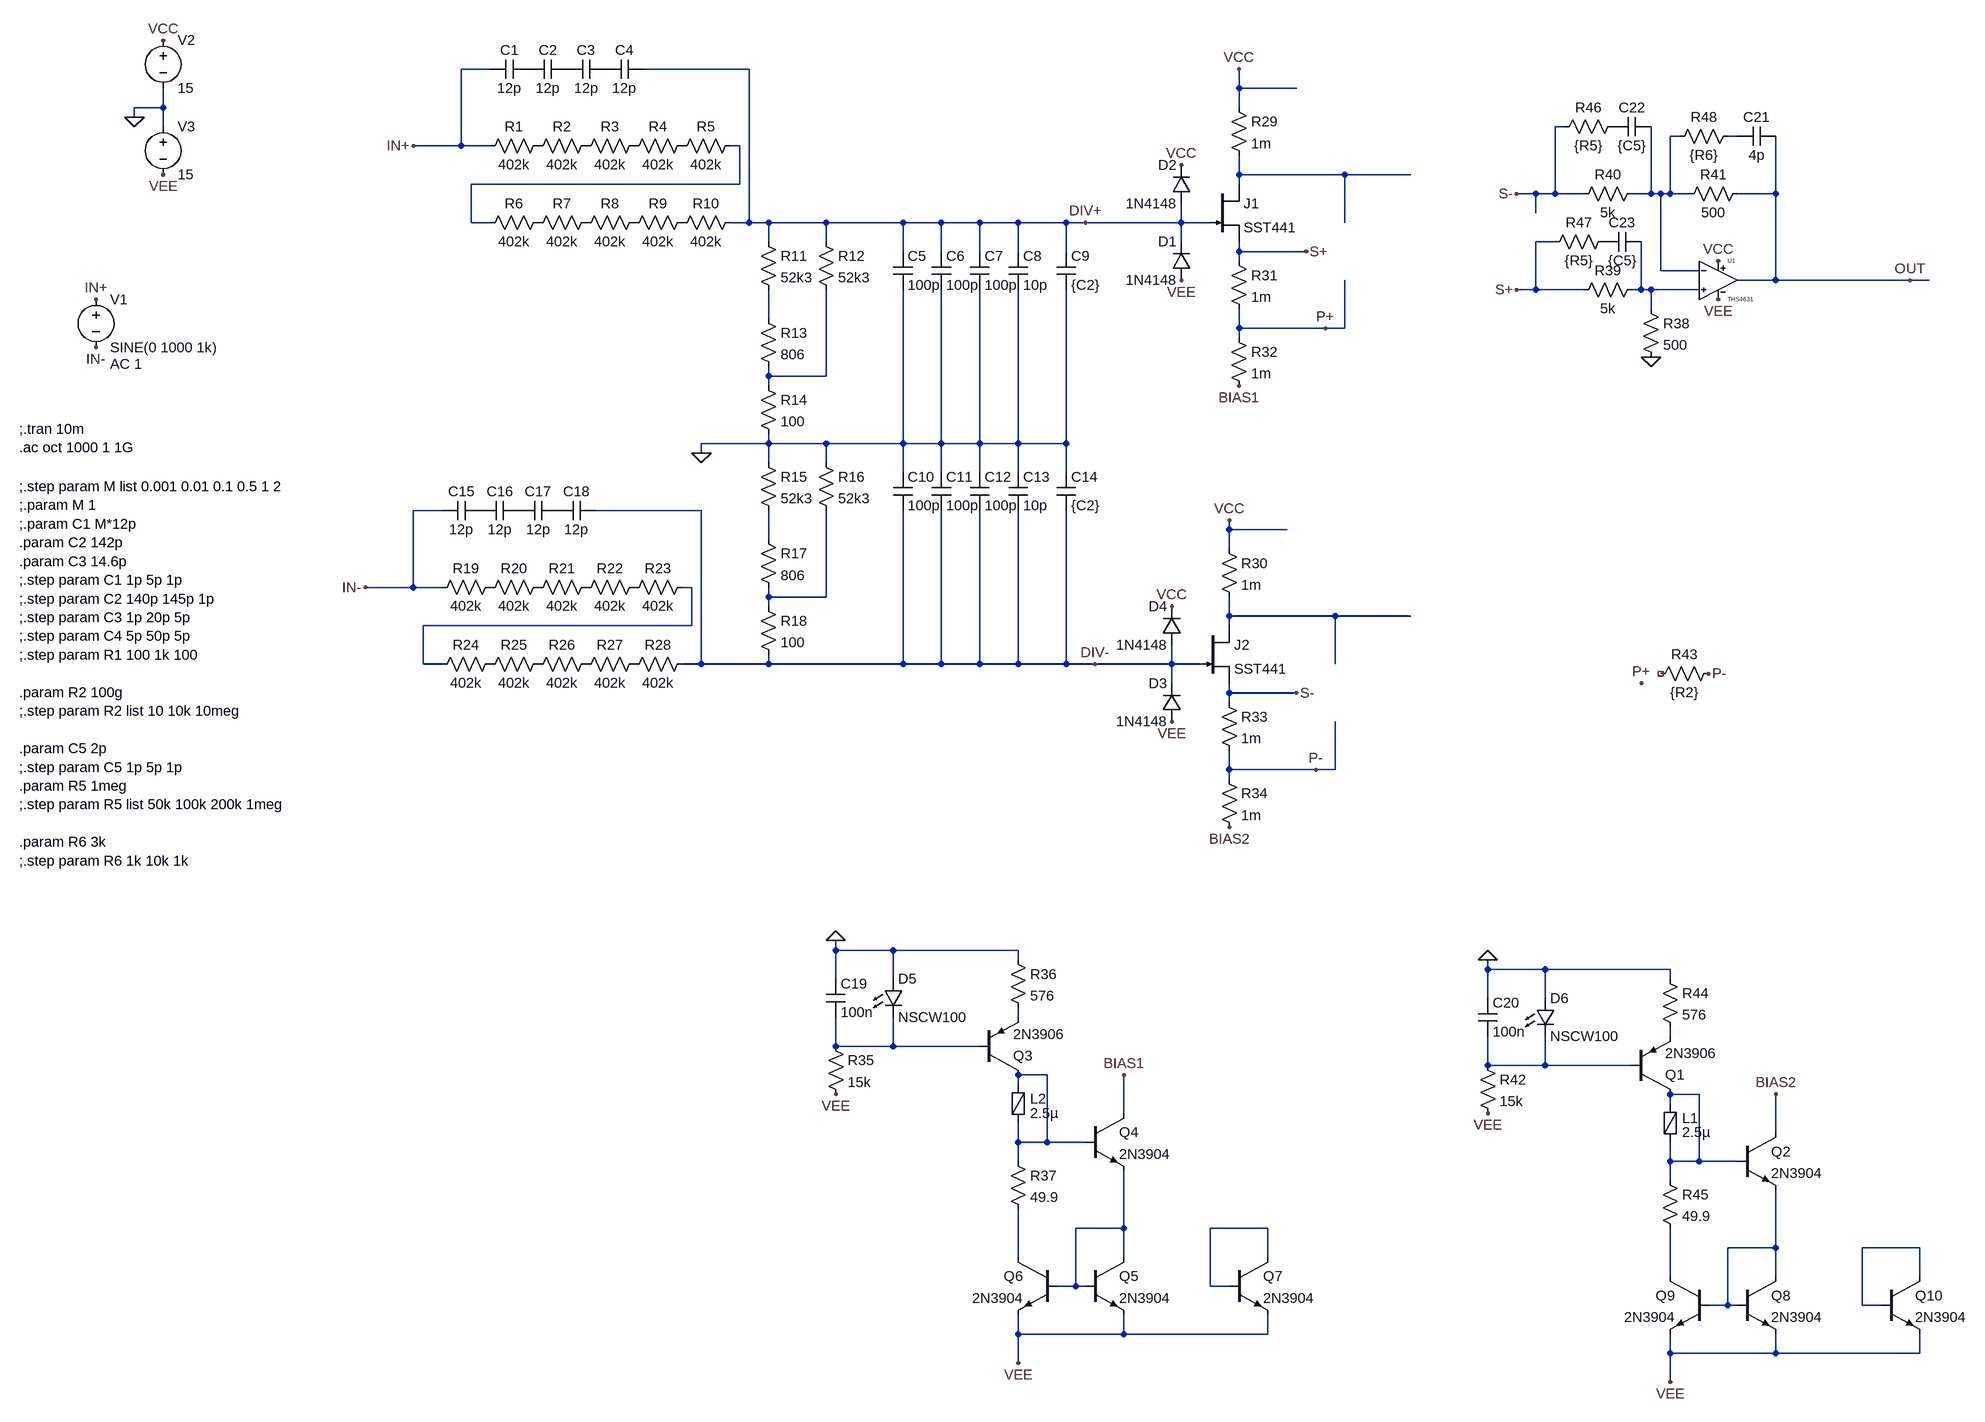
[diagram p0: schematic differential_probe_4_my_test.asc]
differential_probe_4_my_test.asc, the LTspice schematic file:
Version 4
SHEET 1 2400 2236
WIRE -96 -80 -144 -80
WIRE 336 -80 160 -80
WIRE 1152 -48 1152 -80
WIRE 1248 -48 1152 -48
WIRE -736 -16 -736 -48
WIRE -736 -16 -784 -16
WIRE 1152 -16 1152 -48
WIRE -784 0 -784 -16
WIRE -736 16 -736 -16
WIRE 1728 16 1712 16
WIRE 1920 32 1904 32
WIRE 2016 32 2000 32
WIRE -144 48 -144 -80
WIRE -144 48 -224 48
WIRE -96 48 -144 48
WIRE 320 48 304 48
WIRE 1152 96 1152 64
WIRE 1328 96 1152 96
WIRE 1440 96 1328 96
WIRE 320 112 320 48
WIRE 320 112 -128 112
WIRE 1152 112 1152 96
WIRE 1680 128 1648 128
WIRE 1712 128 1712 16
WIRE 1712 128 1680 128
WIRE 1760 128 1712 128
WIRE 1872 128 1872 16
WIRE 1872 128 1840 128
WIRE 1888 128 1872 128
WIRE 1904 128 1904 32
WIRE 1904 128 1888 128
WIRE 1936 128 1904 128
WIRE 2080 128 2080 32
WIRE 2080 128 2016 128
WIRE 1680 160 1680 128
WIRE -128 176 -128 112
WIRE -96 176 -128 176
WIRE 336 176 336 -80
WIRE 336 176 304 176
WIRE 368 176 336 176
WIRE 464 176 368 176
WIRE 592 176 464 176
WIRE 656 176 592 176
WIRE 720 176 656 176
WIRE 784 176 720 176
WIRE 864 176 784 176
WIRE 896 176 864 176
WIRE 1056 176 1056 144
WIRE 1056 176 896 176
WIRE 1104 176 1056 176
WIRE 1328 176 1328 96
WIRE 368 208 368 176
WIRE 464 208 464 176
WIRE 1056 208 1056 176
WIRE 1712 208 1680 208
WIRE 592 224 592 176
WIRE 656 224 656 176
WIRE 720 224 720 176
WIRE 784 224 784 176
WIRE 864 224 864 176
WIRE 1152 224 1152 208
WIRE 1264 224 1152 224
WIRE 1152 240 1152 224
WIRE 1888 256 1888 128
WIRE 1952 256 1888 256
WIRE 2080 272 2080 128
WIRE 2080 272 2016 272
WIRE 2304 272 2080 272
WIRE 2336 272 2304 272
WIRE 1680 288 1680 208
WIRE 1680 288 1648 288
WIRE 1760 288 1680 288
WIRE 1856 288 1856 208
WIRE 1856 288 1840 288
WIRE 1872 288 1856 288
WIRE 1952 288 1872 288
WIRE 1872 320 1872 288
WIRE 368 336 368 288
WIRE 1152 352 1152 320
WIRE 1296 352 1152 352
WIRE 1328 352 1328 272
WIRE 1328 352 1296 352
WIRE 1152 368 1152 352
WIRE 368 432 368 416
WIRE 464 432 464 288
WIRE 464 432 368 432
WIRE 368 448 368 432
WIRE 368 544 368 528
WIRE 368 544 256 544
WIRE 464 544 368 544
WIRE 592 544 592 288
WIRE 592 544 464 544
WIRE 656 544 656 288
WIRE 656 544 592 544
WIRE 720 544 720 288
WIRE 720 544 656 544
WIRE 784 544 784 288
WIRE 784 544 720 544
WIRE 864 544 864 288
WIRE 864 544 784 544
WIRE 256 560 256 544
WIRE 368 576 368 544
WIRE 464 576 464 544
WIRE 592 592 592 544
WIRE 656 592 656 544
WIRE 720 592 720 544
WIRE 784 592 784 544
WIRE 864 592 864 544
WIRE -176 656 -224 656
WIRE 256 656 80 656
WIRE 1136 688 1136 672
WIRE 1232 688 1136 688
WIRE 368 704 368 656
WIRE 1136 720 1136 688
WIRE -224 784 -224 656
WIRE -224 784 -304 784
WIRE -176 784 -224 784
WIRE 240 784 224 784
WIRE 368 800 368 784
WIRE 464 800 464 656
WIRE 464 800 368 800
WIRE 368 816 368 800
WIRE 1136 832 1136 800
WIRE 1312 832 1136 832
WIRE 1440 832 1312 832
WIRE 240 848 240 784
WIRE 240 848 -208 848
WIRE 1136 848 1136 832
WIRE -208 912 -208 848
WIRE -176 912 -208 912
WIRE 256 912 256 656
WIRE 256 912 224 912
WIRE 368 912 368 896
WIRE 368 912 256 912
WIRE 592 912 592 656
WIRE 592 912 368 912
WIRE 656 912 656 656
WIRE 656 912 592 912
WIRE 720 912 720 656
WIRE 720 912 656 912
WIRE 784 912 784 656
WIRE 784 912 720 912
WIRE 864 912 864 656
WIRE 864 912 784 912
WIRE 912 912 864 912
WIRE 1040 912 1040 880
WIRE 1040 912 912 912
WIRE 1088 912 1040 912
WIRE 1312 912 1312 832
WIRE 1040 944 1040 912
WIRE 1136 960 1136 944
WIRE 1248 960 1136 960
WIRE 1136 976 1136 960
WIRE 1136 1088 1136 1056
WIRE 1280 1088 1136 1088
WIRE 1312 1088 1312 1008
WIRE 1312 1088 1280 1088
WIRE 1136 1104 1136 1088
WIRE 480 1424 480 1408
WIRE 576 1424 480 1424
WIRE 784 1424 576 1424
WIRE 784 1440 784 1424
WIRE 1600 1456 1600 1440
WIRE 1696 1456 1600 1456
WIRE 1904 1456 1696 1456
WIRE 480 1472 480 1424
WIRE 576 1472 576 1424
WIRE 1904 1472 1904 1456
WIRE 1600 1504 1600 1456
WIRE 1696 1504 1696 1456
WIRE 784 1536 784 1520
WIRE 1904 1568 1904 1552
WIRE 480 1584 480 1536
WIRE 576 1584 576 1536
WIRE 576 1584 480 1584
WIRE 720 1584 576 1584
WIRE 1600 1616 1600 1568
WIRE 1696 1616 1696 1568
WIRE 1696 1616 1600 1616
WIRE 1840 1616 1696 1616
WIRE 832 1632 784 1632
WIRE 784 1648 784 1632
WIRE 1952 1664 1904 1664
WIRE 1904 1680 1904 1664
WIRE 960 1696 960 1632
WIRE 2080 1728 2080 1664
WIRE 784 1744 784 1712
WIRE 832 1744 832 1632
WIRE 832 1744 784 1744
WIRE 896 1744 832 1744
WIRE 784 1776 784 1744
WIRE 1904 1776 1904 1744
WIRE 1952 1776 1952 1664
WIRE 1952 1776 1904 1776
WIRE 2016 1776 1952 1776
WIRE 1904 1808 1904 1776
WIRE 960 1888 960 1792
WIRE 960 1888 880 1888
WIRE 1200 1888 1104 1888
WIRE 2080 1920 2080 1824
WIRE 2080 1920 2000 1920
WIRE 2320 1920 2224 1920
WIRE 784 1936 784 1856
WIRE 960 1936 960 1888
WIRE 1200 1936 1200 1888
WIRE 1904 1968 1904 1888
WIRE 2080 1968 2080 1920
WIRE 2320 1968 2320 1920
WIRE 880 1984 880 1888
WIRE 880 1984 848 1984
WIRE 896 1984 880 1984
WIRE 1104 1984 1104 1888
WIRE 1136 1984 1104 1984
WIRE 2000 2016 2000 1920
WIRE 2000 2016 1968 2016
WIRE 2016 2016 2000 2016
WIRE 2224 2016 2224 1920
WIRE 2256 2016 2224 2016
WIRE 784 2064 784 2032
WIRE 960 2064 960 2032
WIRE 960 2064 784 2064
WIRE 1200 2064 1200 2032
WIRE 1200 2064 960 2064
WIRE 1904 2096 1904 2064
WIRE 2080 2096 2080 2064
WIRE 2080 2096 1904 2096
WIRE 2320 2096 2320 2064
WIRE 2320 2096 2080 2096
WIRE 784 2112 784 2064
WIRE 1904 2144 1904 2096
FLAG -224 48 IN+
FLAG 256 560 0
FLAG -304 784 IN-
FLAG -848 384 IN-
FLAG -848 304 IN+
FLAG 896 176 DIV+
FLAG 912 912 DIV-
FLAG -784 0 0
FLAG -736 -128 VCC
FLAG -736 96 VEE
FLAG 1040 1008 VEE
FLAG 1056 272 VEE
FLAG 1056 80 VCC
FLAG 1040 816 VCC
FLAG 1152 -80 VCC
FLAG 1136 672 VCC
FLAG 480 1664 VEE
FLAG 480 1408 0
FLAG 1152 448 BIAS1
FLAG 1136 1184 BIAS2
FLAG 960 1632 BIAS1
FLAG 784 2112 VEE
FLAG 1264 224 S+
FLAG 1248 960 S-
FLAG 1984 240 VCC
FLAG 1984 304 VEE
FLAG 1872 400 0
FLAG 2304 272 OUT
FLAG 1648 288 S+
FLAG 1648 128 S-
FLAG 1600 1696 VEE
FLAG 1600 1440 0
FLAG 2080 1664 BIAS2
FLAG 1904 2144 VEE
FLAG 1296 352 P+
FLAG 1280 1088 P-
FLAG 1856 944 P+
FLAG 1968 928 P-
SYMBOL res 0 32 R90
WINDOW 0 0 56 VBottom 2
WINDOW 3 32 56 VTop 2
SYMATTR InstName R1
SYMATTR Value 402k
SYMBOL res 80 32 R90
WINDOW 0 0 56 VBottom 2
WINDOW 3 32 56 VTop 2
SYMATTR InstName R2
SYMATTR Value 402k
SYMBOL res 160 32 R90
WINDOW 0 0 56 VBottom 2
WINDOW 3 32 56 VTop 2
SYMATTR InstName R3
SYMATTR Value 402k
SYMBOL res 240 32 R90
WINDOW 0 0 56 VBottom 2
WINDOW 3 32 56 VTop 2
SYMATTR InstName R4
SYMATTR Value 402k
SYMBOL res 320 32 R90
WINDOW 0 0 56 VBottom 2
WINDOW 3 32 56 VTop 2
SYMATTR InstName R5
SYMATTR Value 402k
SYMBOL res 0 160 R90
WINDOW 0 0 56 VBottom 2
WINDOW 3 32 56 VTop 2
SYMATTR InstName R6
SYMATTR Value 402k
SYMBOL res 80 160 R90
WINDOW 0 0 56 VBottom 2
WINDOW 3 32 56 VTop 2
SYMATTR InstName R7
SYMATTR Value 402k
SYMBOL res 160 160 R90
WINDOW 0 0 56 VBottom 2
WINDOW 3 32 56 VTop 2
SYMATTR InstName R8
SYMATTR Value 402k
SYMBOL res 240 160 R90
WINDOW 0 0 56 VBottom 2
WINDOW 3 32 56 VTop 2
SYMATTR InstName R9
SYMATTR Value 402k
SYMBOL res 320 160 R90
WINDOW 0 0 56 VBottom 2
WINDOW 3 32 56 VTop 2
SYMATTR InstName R10
SYMATTR Value 402k
SYMBOL cap -32 -96 R90
WINDOW 0 0 32 VBottom 2
WINDOW 3 32 32 VTop 2
SYMATTR InstName C1
SYMATTR Value 12p
SYMATTR SpiceLine V=1K Irms=0 Rser=0 Lser=0 mfg="Murata" pn="GCM31A5C3A120JX01" type="C0G"
SYMBOL res 352 192 R0
SYMATTR InstName R11
SYMATTR Value 52k3
SYMBOL res 448 192 R0
SYMATTR InstName R12
SYMATTR Value 52k3
SYMBOL res 352 320 R0
SYMATTR InstName R13
SYMATTR Value 806
SYMBOL res 352 432 R0
SYMATTR InstName R14
SYMATTR Value 100
SYMBOL cap 576 224 R0
SYMATTR InstName C5
SYMATTR Value 100p
SYMATTR SpiceLine V=1K Irms=0 Rser=0 Lser=0
SYMBOL cap 848 224 R0
SYMATTR InstName C9
SYMATTR Value {C2}
SYMBOL res 352 560 R0
SYMATTR InstName R15
SYMATTR Value 52k3
SYMBOL res 448 560 R0
SYMATTR InstName R16
SYMATTR Value 52k3
SYMBOL res 352 688 R0
SYMATTR InstName R17
SYMATTR Value 806
SYMBOL res 352 800 R0
SYMATTR InstName R18
SYMATTR Value 100
SYMBOL cap 848 592 R0
SYMATTR InstName C14
SYMATTR Value {C2}
SYMBOL res -80 768 R90
WINDOW 0 0 56 VBottom 2
WINDOW 3 32 56 VTop 2
SYMATTR InstName R19
SYMATTR Value 402k
SYMBOL res 0 768 R90
WINDOW 0 0 56 VBottom 2
WINDOW 3 32 56 VTop 2
SYMATTR InstName R20
SYMATTR Value 402k
SYMBOL res 80 768 R90
WINDOW 0 0 56 VBottom 2
WINDOW 3 32 56 VTop 2
SYMATTR InstName R21
SYMATTR Value 402k
SYMBOL res 160 768 R90
WINDOW 0 0 56 VBottom 2
WINDOW 3 32 56 VTop 2
SYMATTR InstName R22
SYMATTR Value 402k
SYMBOL res 240 768 R90
WINDOW 0 0 56 VBottom 2
WINDOW 3 32 56 VTop 2
SYMATTR InstName R23
SYMATTR Value 402k
SYMBOL res -80 896 R90
WINDOW 0 0 56 VBottom 2
WINDOW 3 32 56 VTop 2
SYMATTR InstName R24
SYMATTR Value 402k
SYMBOL res 0 896 R90
WINDOW 0 0 56 VBottom 2
WINDOW 3 32 56 VTop 2
SYMATTR InstName R25
SYMATTR Value 402k
SYMBOL res 80 896 R90
WINDOW 0 0 56 VBottom 2
WINDOW 3 32 56 VTop 2
SYMATTR InstName R26
SYMATTR Value 402k
SYMBOL res 160 896 R90
WINDOW 0 0 56 VBottom 2
WINDOW 3 32 56 VTop 2
SYMATTR InstName R27
SYMATTR Value 402k
SYMBOL res 240 896 R90
WINDOW 0 0 56 VBottom 2
WINDOW 3 32 56 VTop 2
SYMATTR InstName R28
SYMATTR Value 402k
SYMBOL voltage -848 288 R0
WINDOW 123 24 124 Left 2
WINDOW 39 0 0 Left 0
SYMATTR Value2 AC 1
SYMATTR InstName V1
SYMATTR Value SINE(0 1000 1k)
SYMBOL cap 32 -96 R90
WINDOW 0 0 32 VBottom 2
WINDOW 3 32 32 VTop 2
SYMATTR InstName C2
SYMATTR Value 12p
SYMATTR SpiceLine V=1K Irms=0 Rser=0 Lser=0 mfg="Murata" pn="GCM31A5C3A120JX01" type="C0G"
SYMBOL cap 96 -96 R90
WINDOW 0 0 32 VBottom 2
WINDOW 3 32 32 VTop 2
SYMATTR InstName C3
SYMATTR Value 12p
SYMATTR SpiceLine V=1K Irms=0 Rser=0 Lser=0 mfg="Murata" pn="GCM31A5C3A120JX01" type="C0G"
SYMBOL cap 160 -96 R90
WINDOW 0 0 32 VBottom 2
WINDOW 3 32 32 VTop 2
SYMATTR InstName C4
SYMATTR Value 12p
SYMATTR SpiceLine V=1K Irms=0 Rser=0 Lser=0 mfg="Murata" pn="GCM31A5C3A120JX01" type="C0G"
SYMBOL cap -112 640 R90
WINDOW 0 0 32 VBottom 2
WINDOW 3 32 32 VTop 2
SYMATTR InstName C15
SYMATTR Value 12p
SYMATTR SpiceLine V=1K Irms=0 Rser=0 Lser=0 mfg="Murata" pn="GCM31A5C3A120JX01" type="C0G"
SYMBOL cap -48 640 R90
WINDOW 0 0 32 VBottom 2
WINDOW 3 32 32 VTop 2
SYMATTR InstName C16
SYMATTR Value 12p
SYMATTR SpiceLine V=1K Irms=0 Rser=0 Lser=0 mfg="Murata" pn="GCM31A5C3A120JX01" type="C0G"
SYMBOL cap 16 640 R90
WINDOW 0 0 32 VBottom 2
WINDOW 3 32 32 VTop 2
SYMATTR InstName C17
SYMATTR Value 12p
SYMATTR SpiceLine V=1K Irms=0 Rser=0 Lser=0 mfg="Murata" pn="GCM31A5C3A120JX01" type="C0G"
SYMBOL cap 80 640 R90
WINDOW 0 0 32 VBottom 2
WINDOW 3 32 32 VTop 2
SYMATTR InstName C18
SYMATTR Value 12p
SYMATTR SpiceLine V=1K Irms=0 Rser=0 Lser=0 mfg="Murata" pn="GCM31A5C3A120JX01" type="C0G"
SYMBOL cap 640 224 R0
SYMATTR InstName C6
SYMATTR Value 100p
SYMATTR SpiceLine V=1K Irms=0 Rser=0 Lser=0
SYMBOL cap 704 224 R0
SYMATTR InstName C7
SYMATTR Value 100p
SYMATTR SpiceLine V=1K Irms=0 Rser=0 Lser=0
SYMBOL cap 576 592 R0
SYMATTR InstName C10
SYMATTR Value 100p
SYMATTR SpiceLine V=1K Irms=0 Rser=0 Lser=0
SYMBOL cap 640 592 R0
SYMATTR InstName C11
SYMATTR Value 100p
SYMATTR SpiceLine V=1K Irms=0 Rser=0 Lser=0
SYMBOL cap 704 592 R0
SYMATTR InstName C12
SYMATTR Value 100p
SYMATTR SpiceLine V=1K Irms=0 Rser=0 Lser=0
SYMBOL cap 768 592 R0
SYMATTR InstName C13
SYMATTR Value 10p
SYMATTR SpiceLine V=1K Irms=0 Rser=0 Lser=0
SYMBOL cap 768 224 R0
SYMATTR InstName C8
SYMATTR Value 10p
SYMATTR SpiceLine V=1K Irms=0 Rser=0 Lser=0
SYMBOL diode 1072 272 R180
WINDOW 0 24 64 Left 2
WINDOW 3 24 0 Left 2
SYMATTR InstName D1
SYMATTR Value 1N4148
SYMBOL diode 1072 144 R180
WINDOW 0 24 64 Left 2
WINDOW 3 24 0 Left 2
SYMATTR InstName D2
SYMATTR Value 1N4148
SYMBOL diode 1056 1008 R180
WINDOW 0 24 64 Left 2
WINDOW 3 24 0 Left 2
SYMATTR InstName D3
SYMATTR Value 1N4148
SYMBOL diode 1056 880 R180
WINDOW 0 24 64 Left 2
WINDOW 3 24 0 Left 2
SYMATTR InstName D4
SYMATTR Value 1N4148
SYMBOL voltage -736 -144 R0
WINDOW 123 0 0 Left 0
WINDOW 39 0 0 Left 0
SYMATTR InstName V2
SYMATTR Value 15
SYMBOL voltage -736 0 R0
WINDOW 123 0 0 Left 0
WINDOW 39 0 0 Left 0
SYMATTR InstName V3
SYMATTR Value 15
SYMBOL njf 1104 112 R0
SYMATTR InstName J1
SYMATTR Value SST441
SYMBOL res 1136 -32 R0
SYMATTR InstName R29
SYMATTR Value 1m
SYMBOL res 1136 224 R0
SYMATTR InstName R31
SYMATTR Value 1m
SYMBOL res 1136 352 R0
SYMATTR InstName R32
SYMATTR Value 1m
SYMBOL njf 1088 848 R0
SYMATTR InstName J2
SYMATTR Value SST441
SYMBOL res 1120 704 R0
SYMATTR InstName R30
SYMATTR Value 1m
SYMBOL res 1120 960 R0
SYMATTR InstName R33
SYMATTR Value 1m
SYMBOL res 1120 1088 R0
SYMATTR InstName R34
SYMATTR Value 1m
SYMBOL res 464 1568 R0
SYMATTR InstName R35
SYMATTR Value 15k
SYMBOL cap 464 1472 R0
SYMATTR InstName C19
SYMATTR Value 100n
SYMBOL LED 560 1472 R0
SYMATTR InstName D5
SYMATTR Value NSCW100
SYMBOL res 768 1424 R0
SYMATTR InstName R36
SYMATTR Value 576
SYMBOL pnp 720 1632 M180
SYMATTR InstName Q3
SYMATTR Value 2N3906
SYMBOL FerriteBead 784 1680 R0
SYMATTR InstName L2
SYMATTR Value 2.5µ
SYMATTR SpiceLine Ipk=1 Rser=0.157 Rpar=605 Cpar=1.1p mfg="Würth Elektronik" pn="782633601 WE-CBA 0603"
SYMBOL res 768 1760 R0
SYMATTR InstName R37
SYMATTR Value 49.9
SYMBOL npn 896 1696 R0
SYMATTR InstName Q4
SYMATTR Value 2N3904
SYMBOL npn 896 1936 R0
SYMATTR InstName Q5
SYMATTR Value 2N3904
SYMBOL npn 848 1936 M0
SYMATTR InstName Q6
SYMATTR Value 2N3904
SYMBOL npn 1136 1936 R0
SYMATTR InstName Q7
SYMATTR Value 2N3904
SYMBOL res 1856 304 R0
SYMATTR InstName R38
SYMATTR Value 500
SYMBOL res 1856 272 R90
WINDOW 0 0 56 VBottom 2
WINDOW 3 32 56 VTop 2
SYMATTR InstName R39
SYMATTR Value 5k
SYMBOL res 1856 112 R90
WINDOW 0 0 56 VBottom 2
WINDOW 3 32 56 VTop 2
SYMATTR InstName R40
SYMATTR Value 5k
SYMBOL res 2032 112 R90
WINDOW 0 0 56 VBottom 2
WINDOW 3 32 56 VTop 2
SYMATTR InstName R41
SYMATTR Value 500
SYMBOL THS4631 1984 208 R0
SYMATTR InstName U1
SYMBOL res 1584 1600 R0
SYMATTR InstName R42
SYMATTR Value 15k
SYMBOL cap 1584 1504 R0
SYMATTR InstName C20
SYMATTR Value 100n
SYMBOL LED 1680 1504 R0
SYMATTR InstName D6
SYMATTR Value NSCW100
SYMBOL res 1888 1456 R0
SYMATTR InstName R44
SYMATTR Value 576
SYMBOL pnp 1840 1664 M180
SYMATTR InstName Q1
SYMATTR Value 2N3906
SYMBOL FerriteBead 1904 1712 R0
SYMATTR InstName L1
SYMATTR Value 2.5µ
SYMATTR SpiceLine Ipk=1 Rser=0.157 Rpar=605 Cpar=1.1p mfg="Würth Elektronik" pn="782633601 WE-CBA 0603"
SYMBOL res 1888 1792 R0
SYMATTR InstName R45
SYMATTR Value 49.9
SYMBOL npn 2016 1728 R0
SYMATTR InstName Q2
SYMATTR Value 2N3904
SYMBOL npn 2016 1968 R0
SYMATTR InstName Q8
SYMATTR Value 2N3904
SYMBOL npn 1968 1968 M0
SYMATTR InstName Q9
SYMATTR Value 2N3904
SYMBOL npn 2256 1968 R0
SYMATTR InstName Q10
SYMATTR Value 2N3904
SYMBOL cap 2080 16 R90
WINDOW 0 0 32 VBottom 2
WINDOW 3 32 32 VTop 2
SYMATTR InstName C21
SYMATTR Value 4p
SYMBOL res 1984 912 R90
WINDOW 0 0 56 VBottom 2
WINDOW 3 32 56 VTop 2
SYMATTR InstName R43
SYMATTR Value {R2}
SYMBOL cap 1872 0 R90
WINDOW 0 0 32 VBottom 2
WINDOW 3 32 32 VTop 2
SYMATTR InstName C22
SYMATTR Value {C5}
SYMBOL cap 1856 192 R90
WINDOW 0 0 32 VBottom 2
WINDOW 3 32 32 VTop 2
SYMATTR InstName C23
SYMATTR Value {C5}
SYMBOL res 1824 0 R90
WINDOW 0 0 56 VBottom 2
WINDOW 3 32 56 VTop 2
SYMATTR InstName R46
SYMATTR Value {R5}
SYMBOL res 1808 192 R90
WINDOW 0 0 56 VBottom 2
WINDOW 3 32 56 VTop 2
SYMATTR InstName R47
SYMATTR Value {R5}
SYMBOL res 2016 16 R90
WINDOW 0 0 56 VBottom 2
WINDOW 3 32 56 VTop 2
SYMATTR InstName R48
SYMATTR Value {R6}
TEXT -976 520 Left 2 !;.tran 10m\n.ac oct 1000 1 1G
TEXT -976 616 Left 2 !;.step param M list 0.001 0.01 0.1 0.5 1 2\n;.param M 1\n;.param C1 M*12p\n.param C2 142p\n.param C3 14.6p\n;.step param C1 1p 5p 1p\n;.step param C2 140p 145p 1p\n;.step param C3 1p 20p 5p\n;.step param C4 5p 50p 5p\n;.step param R1 100 1k 100\n \n.param R2 100g\n;.step param R2 list 10 10k 10meg\n \n.param C5 2p\n;.step param C5 1p 5p 1p\n.param R5 1meg\n;.step param R5 list 50k 100k 200k 1meg\n \n.param R6 3k\n;.step param R6 1k 10k 1k

The netlist it stands for:
* differential_probe_4_my_test.asc
R1 P001 IN+ 402k
R2 P002 P001 402k
R3 P003 P002 402k
R4 P004 P003 402k
R5 N003 P004 402k
R6 P005 N003 402k
R7 P006 P005 402k
R8 P007 P006 402k
R9 P008 P007 402k
R10 DIV+ P008 402k
C1 P009 IN+ 12p V=1K Irms=0 Rser=0 Lser=0 mfg="Murata" pn="GCM31A5C3A120JX01" type="C0G"
R11 DIV+ N006 52k3
R12 DIV+ N007 52k3
R13 N006 N007 806
R14 N007 0 100
C5 DIV+ 0 100p V=1K Irms=0 Rser=0 Lser=0
C9 DIV+ 0 {C2}
R15 0 N008 52k3
R16 0 N010 52k3
R17 N008 N010 806
R18 N010 DIV- 100
C14 0 DIV- {C2}
R19 P010 IN- 402k
R20 P011 P010 402k
R21 P012 P011 402k
R22 P013 P012 402k
R23 N009 P013 402k
R24 P014 N009 402k
R25 P015 P014 402k
R26 P016 P015 402k
R27 P017 P016 402k
R28 DIV- P017 402k
V1 IN+ IN- SINE(0 1000 1k) AC 1
C2 P018 P009 12p V=1K Irms=0 Rser=0 Lser=0 mfg="Murata" pn="GCM31A5C3A120JX01" type="C0G"
C3 P019 P018 12p V=1K Irms=0 Rser=0 Lser=0 mfg="Murata" pn="GCM31A5C3A120JX01" type="C0G"
C4 DIV+ P019 12p V=1K Irms=0 Rser=0 Lser=0 mfg="Murata" pn="GCM31A5C3A120JX01" type="C0G"
C15 P020 IN- 12p V=1K Irms=0 Rser=0 Lser=0 mfg="Murata" pn="GCM31A5C3A120JX01" type="C0G"
C16 P021 P020 12p V=1K Irms=0 Rser=0 Lser=0 mfg="Murata" pn="GCM31A5C3A120JX01" type="C0G"
C17 P022 P021 12p V=1K Irms=0 Rser=0 Lser=0 mfg="Murata" pn="GCM31A5C3A120JX01" type="C0G"
C18 DIV- P022 12p V=1K Irms=0 Rser=0 Lser=0 mfg="Murata" pn="GCM31A5C3A120JX01" type="C0G"
C6 DIV+ 0 100p V=1K Irms=0 Rser=0 Lser=0
C7 DIV+ 0 100p V=1K Irms=0 Rser=0 Lser=0
C10 0 DIV- 100p V=1K Irms=0 Rser=0 Lser=0
C11 0 DIV- 100p V=1K Irms=0 Rser=0 Lser=0
C12 0 DIV- 100p V=1K Irms=0 Rser=0 Lser=0
C13 0 DIV- 10p V=1K Irms=0 Rser=0 Lser=0
C8 DIV+ 0 10p V=1K Irms=0 Rser=0 Lser=0
D1 VEE DIV+ 1N4148
D2 DIV+ VCC 1N4148
D3 VEE DIV- 1N4148
D4 DIV- VCC 1N4148
V2 VCC 0 15
V3 0 VEE 15
J1 N004 DIV+ S+ SST441
R29 VCC N004 1m
R31 S+ P+ 1m
R32 P+ BIAS1 1m
J2 N011 DIV- S- SST441
R30 VCC N011 1m
R33 S- P- 1m
R34 P- BIAS2 1m
R35 N014 VEE 15k
C19 0 N014 100n
D5 0 N014 NSCW100
R36 0 N012 576
Q3 N016 N014 N012 0 2N3906
L2 N016 N016 2.5µ Ipk=1 Rser=0.157 Rpar=605 Cpar=1.1p mfg="Würth Elektronik" pn="782633601 WE-CBA 0603"
R37 N016 N022 49.9
Q4 BIAS1 N016 N018 0 2N3904
Q5 N018 N018 VEE 0 2N3904
Q6 N022 N018 VEE 0 2N3904
Q7 N019 N019 VEE 0 2N3904
R38 N005 0 500
R39 N005 S+ 5k
R40 N001 S- 5k
R41 OUT N001 500
XU1 N005 N001 VCC VEE OUT THS4631  ; pins IN+ IN- VCC VEE OUT
R42 N015 VEE 15k
C20 0 N015 100n
D6 0 N015 NSCW100
R44 0 N013 576
Q1 N017 N015 N013 0 2N3906
L1 N017 N017 2.5µ Ipk=1 Rser=0.157 Rpar=605 Cpar=1.1p mfg="Würth Elektronik" pn="782633601 WE-CBA 0603"
R45 N017 N023 49.9
Q2 BIAS2 N017 N020 0 2N3904
Q8 N020 N020 VEE 0 2N3904
Q9 N023 N020 VEE 0 2N3904
Q10 N021 N021 VEE 0 2N3904
C21 OUT N002 4p
R43 P- NC_01 {R2}
C22 N001 P023 {C5}
C23 N005 P024 {C5}
R46 P023 S- {R5}
R47 P024 S+ {R5}
R48 N002 N001 {R6}
.model D D
.lib standard.dio
.model NPN NPN
.model PNP PNP
.lib standard.bjt
.model NJF NJF
.model PJF PJF
.lib standard.jft
;.tran 10m
.ac oct 1000 1 1G
;.step param M list 0.001 0.01 0.1 0.5 1 2
;.param M 1
;.param C1 M*12p
.param C2 142p
.param C3 14.6p
;.step param C1 1p 5p 1p
;.step param C2 140p 145p 1p
;.step param C3 1p 20p 5p
;.step param C4 5p 50p 5p
;.step param R1 100 1k 100
.param R2 100g
;.step param R2 list 10 10k 10meg
.param C5 2p
;.step param C5 1p 5p 1p
.param R5 1meg
;.step param R5 list 50k 100k 200k 1meg
.param R6 3k
;.step param R6 1k 10k 1k
.lib THS4631.lib
.backanno
.end